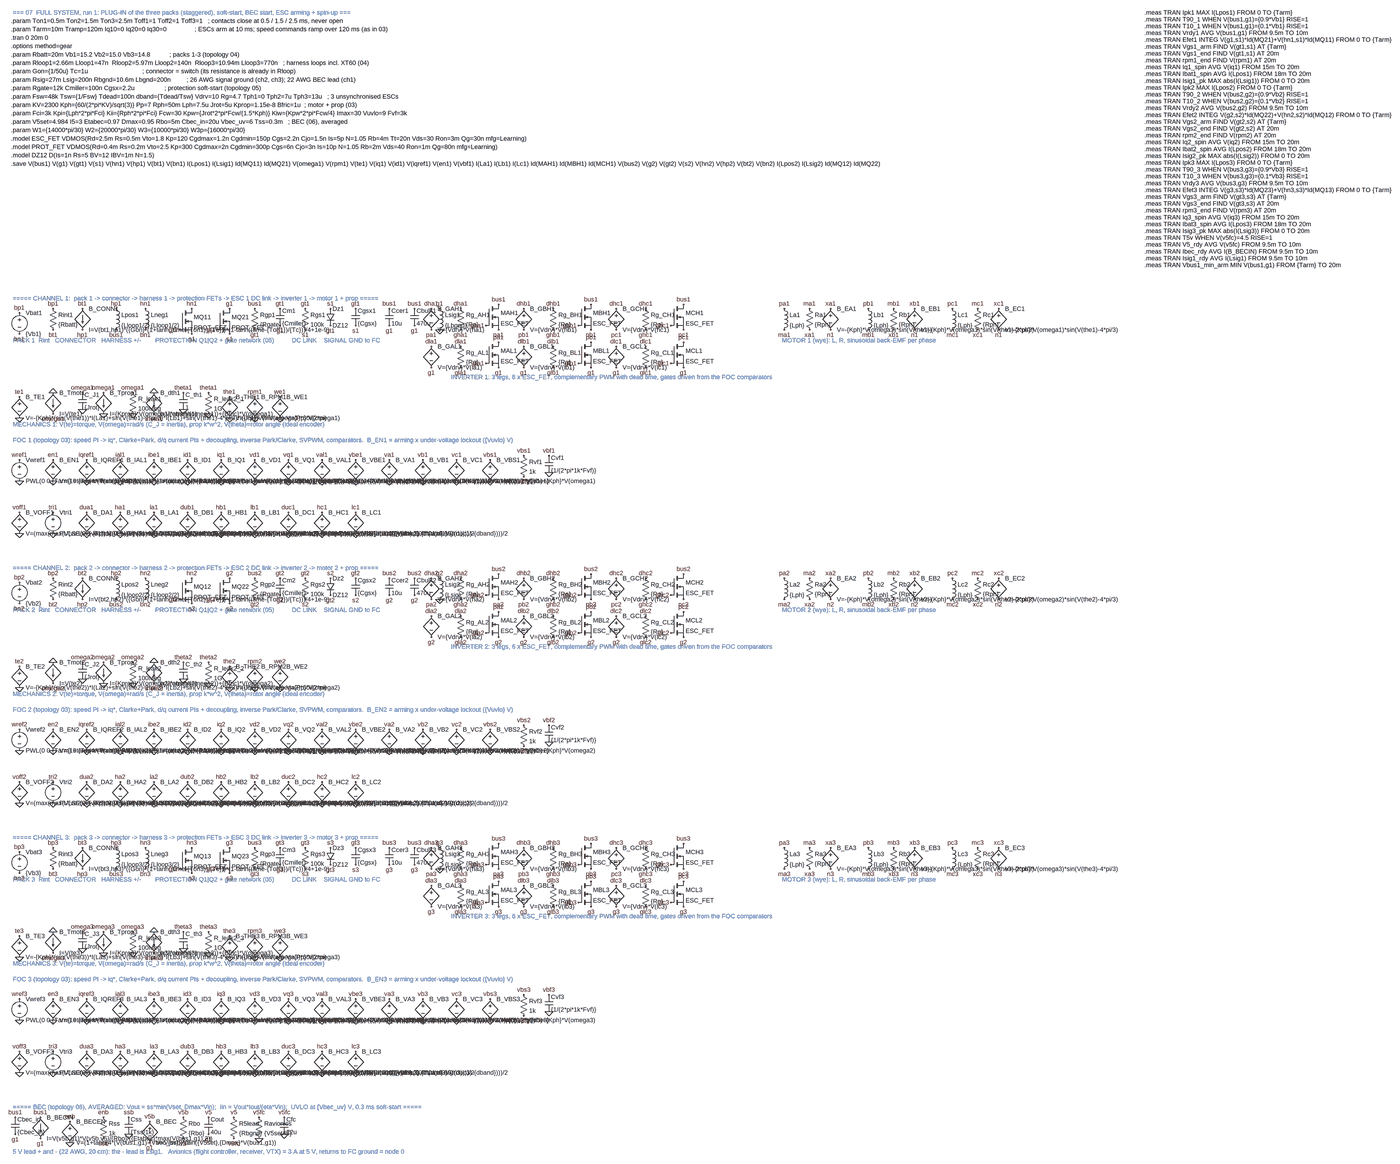
[diagram p0: schematic FullSystem_PlugIn.asc, whole sheet]
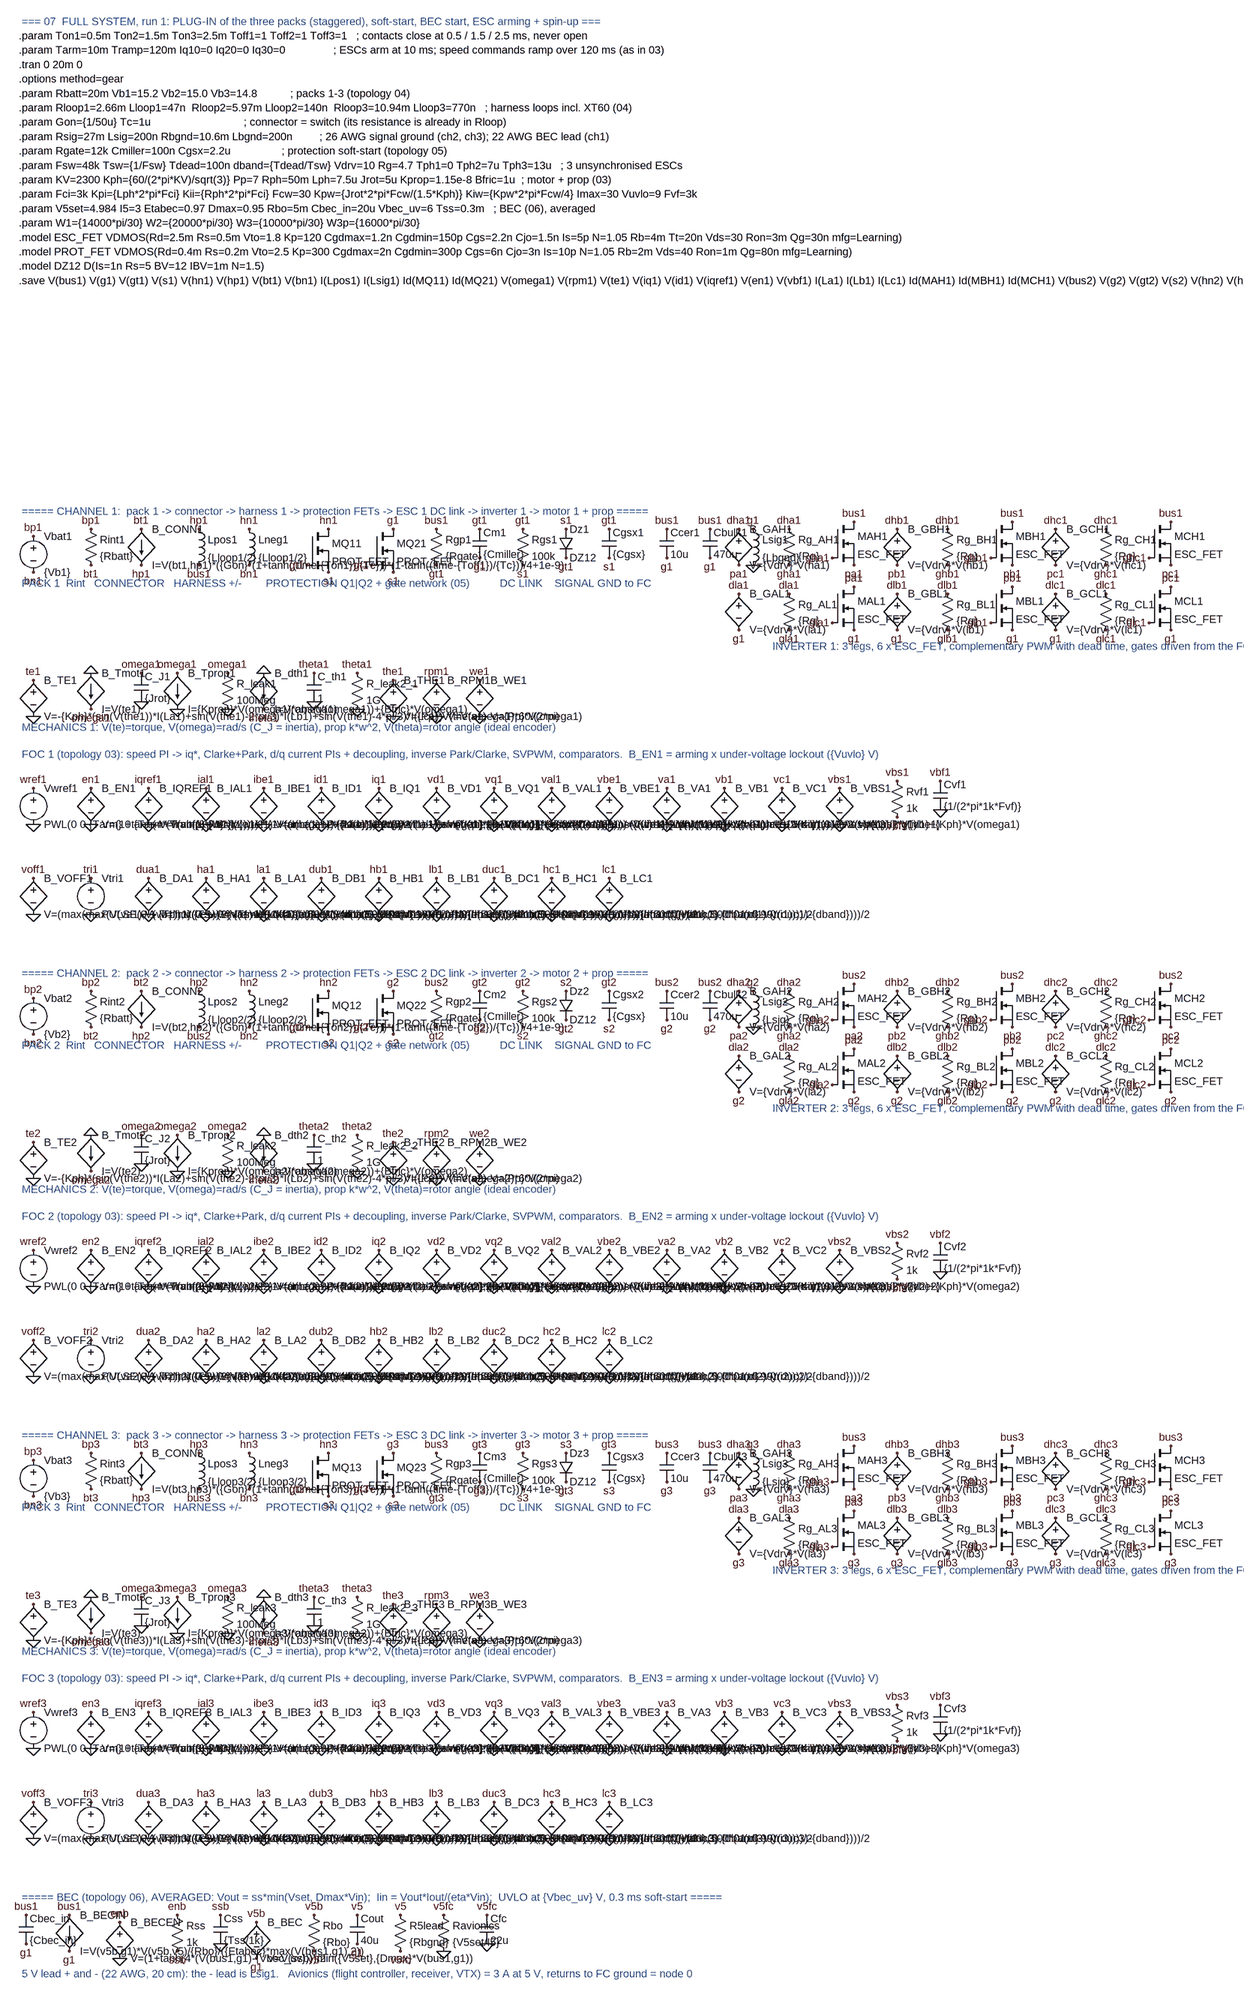
[diagram p1: schematic FullSystem_PlugIn.asc, part, row 1 of 1, column 1 of 2]
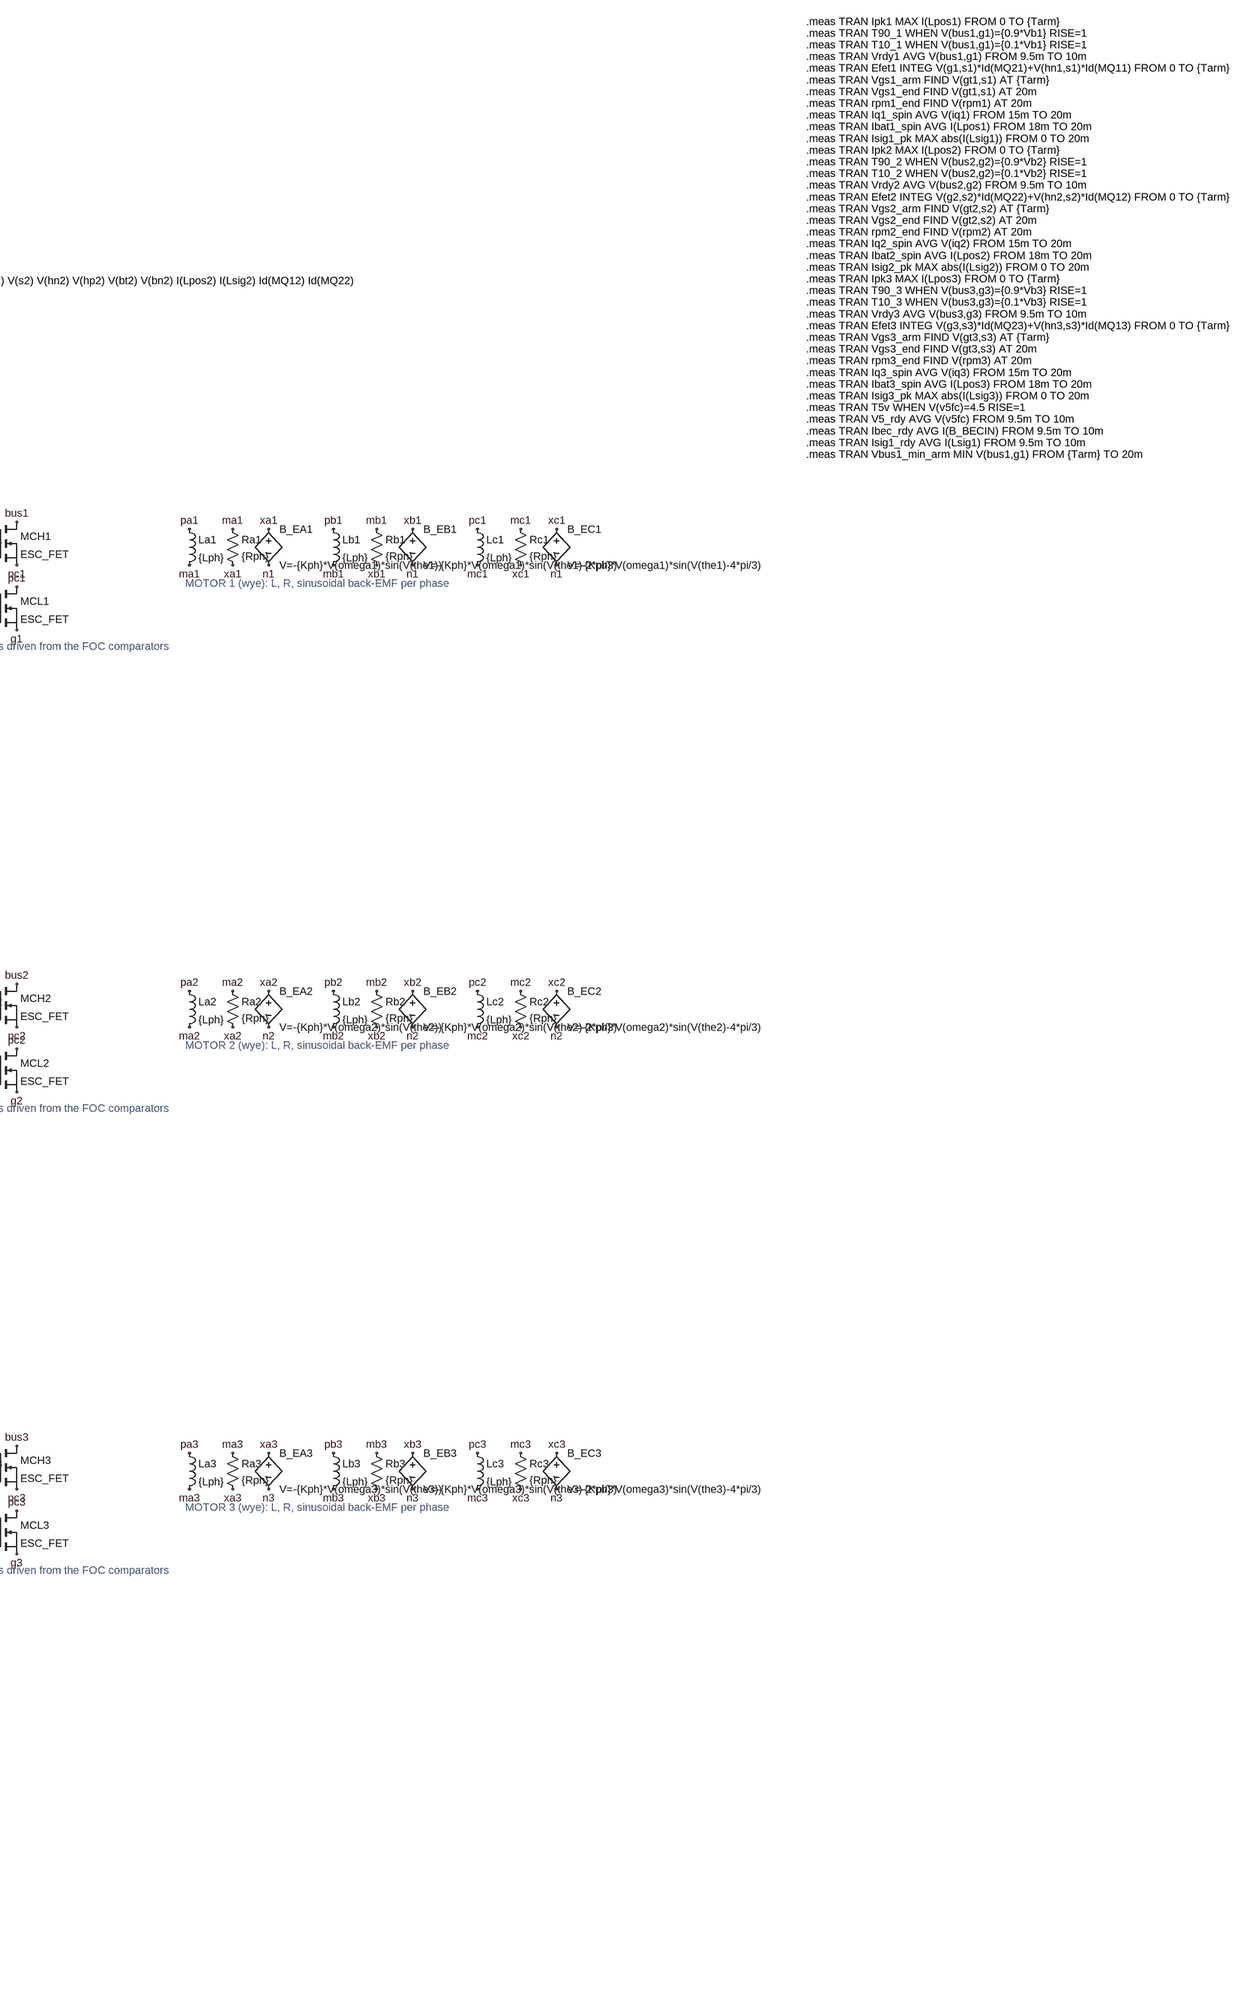
[diagram p2: schematic FullSystem_PlugIn.asc, part, row 1 of 1, column 2 of 2]
* FullSystem_PlugIn.asc
Vbat1 bp1 bn1 {Vb1}
Rint1 bp1 bt1 {Rbatt}
B_CONN1 bt1 hp1 I=V(bt1,hp1)*({Gon}*(1+tanh((time-{Ton1})/{Tc}))*(1-tanh((time-{Toff1})/{Tc}))/4+1e-9)
Lpos1 hp1 bus1 {Lloop1/2} Rser={Rloop1/2}
Lneg1 hn1 bn1 {Lloop1/2} Rser={Rloop1/2}
MQ11 hn1 gt1 s1 s1 PROT_FET
MQ21 g1 gt1 s1 s1 PROT_FET
Rgp1 bus1 gt1 {Rgate}
Cm1 gt1 g1 {Cmiller}
Rgs1 gt1 s1 100k
Dz1 s1 gt1 DZ12
Cgsx1 gt1 s1 {Cgsx}
Ccer1 bus1 g1 10u Rser=2m
Cbulk1 bus1 g1 470u Rser=30m Lser=10n
Lsig1 g1 0 {Lbgnd} Rser={Rbgnd}
MAH1 bus1 gha1 pa1 pa1 ESC_FET
MAL1 pa1 gla1 g1 g1 ESC_FET
Rg_AH1 dha1 gha1 {Rg}
Rg_AL1 dla1 gla1 {Rg}
B_GAH1 dha1 pa1 V={Vdrv}*V(ha1)
B_GAL1 dla1 g1 V={Vdrv}*V(la1)
MBH1 bus1 ghb1 pb1 pb1 ESC_FET
MBL1 pb1 glb1 g1 g1 ESC_FET
Rg_BH1 dhb1 ghb1 {Rg}
Rg_BL1 dlb1 glb1 {Rg}
B_GBH1 dhb1 pb1 V={Vdrv}*V(hb1)
B_GBL1 dlb1 g1 V={Vdrv}*V(lb1)
MCH1 bus1 ghc1 pc1 pc1 ESC_FET
MCL1 pc1 glc1 g1 g1 ESC_FET
Rg_CH1 dhc1 ghc1 {Rg}
Rg_CL1 dlc1 glc1 {Rg}
B_GCH1 dhc1 pc1 V={Vdrv}*V(hc1)
B_GCL1 dlc1 g1 V={Vdrv}*V(lc1)
La1 pa1 ma1 {Lph}
Ra1 ma1 xa1 {Rph}
B_EA1 xa1 n1 V=-{Kph}*V(omega1)*sin(V(the1))
Lb1 pb1 mb1 {Lph}
Rb1 mb1 xb1 {Rph}
B_EB1 xb1 n1 V=-{Kph}*V(omega1)*sin(V(the1)-2*pi/3)
Lc1 pc1 mc1 {Lph}
Rc1 mc1 xc1 {Rph}
B_EC1 xc1 n1 V=-{Kph}*V(omega1)*sin(V(the1)-4*pi/3)
B_TE1 te1 0 V=-{Kph}*(sin(V(the1))*I(La1)+sin(V(the1)-2*pi/3)*I(Lb1)+sin(V(the1)-4*pi/3)*I(Lc1))
B_Tmot1 0 omega1 I=V(te1)
C_J1 omega1 0 {Jrot}
B_Tprop1 omega1 0 I={Kprop}*V(omega1)*abs(V(omega1))+{Bfric}*V(omega1)
R_leak1 omega1 0 100Meg
B_dth1 0 theta1 I=V(omega1)
C_th1 theta1 0 1
R_leak2_1 theta1 0 1G
B_THE1 the1 0 V={Pp}*V(theta1)
B_RPM1 rpm1 0 V=V(omega1)*60/(2*pi)
B_WE1 we1 0 V={Pp}*V(omega1)
Vwref1 wref1 0 PWL(0 0 {Tarm} 0 {Tarm+Tramp} {W1})
B_EN1 en1 0 V=(1+tanh(4*(V(vbf1)-{Vuvlo})))/2*(1+tanh((time-{Tarm})/20u))/2
B_IQREF1 iqref1 0 V=limit({Kpw}*(V(wref1)-V(omega1))+{Kiw}*idt(V(wref1)-V(omega1),{Iq10/Kiw}),-{Imax},{Imax})
B_IAL1 ial1 0 V=I(La1)
B_IBE1 ibe1 0 V=(I(La1)+2*I(Lb1))/sqrt(3)
B_ID1 id1 0 V=V(ial1)*cos(V(the1))+V(ibe1)*sin(V(the1))
B_IQ1 iq1 0 V=-V(ial1)*sin(V(the1))+V(ibe1)*cos(V(the1))
B_VD1 vd1 0 V={Kpi}*(0-V(id1))+{Kii}*idt(0-V(id1)) - V(we1)*{Lph}*V(iq1)
B_VQ1 vq1 0 V={Kpi}*(V(iqref1)-V(iq1))+{Kii}*idt(V(iqref1)-V(iq1),{Rph*Iq10/Kii}) + V(we1)*{Lph}*V(id1)+{Kph}*V(omega1)
B_VAL1 val1 0 V=V(vd1)*cos(V(the1))-V(vq1)*sin(V(the1))
B_VBE1 vbe1 0 V=V(vd1)*sin(V(the1))+V(vq1)*cos(V(the1))
B_VA1 va1 0 V=V(val1)
B_VB1 vb1 0 V=-V(val1)/2+sqrt(3)/2*V(vbe1)
B_VC1 vc1 0 V=-V(val1)/2-sqrt(3)/2*V(vbe1)
B_VOFF1 voff1 0 V=(max(max(V(va1),V(vb1)),V(vc1))+min(min(V(va1),V(vb1)),V(vc1)))/2
Vtri1 tri1 0 PULSE(0 1 {Tph1} {Tsw/2} {Tsw/2} 0 {Tsw})
B_DA1 dua1 0 V=limit(0.5+(V(va1)-V(voff1))/max(V(vbf1),3), 0.01, 0.99)
B_HA1 ha1 0 V=V(en1)*(1+tanh(500*(V(dua1)-{dband}-V(tri1))))/2
B_LA1 la1 0 V=V(en1)*(1+tanh(500*(V(tri1)-V(dua1)-{dband})))/2
B_DB1 dub1 0 V=limit(0.5+(V(vb1)-V(voff1))/max(V(vbf1),3), 0.01, 0.99)
B_HB1 hb1 0 V=V(en1)*(1+tanh(500*(V(dub1)-{dband}-V(tri1))))/2
B_LB1 lb1 0 V=V(en1)*(1+tanh(500*(V(tri1)-V(dub1)-{dband})))/2
B_DC1 duc1 0 V=limit(0.5+(V(vc1)-V(voff1))/max(V(vbf1),3), 0.01, 0.99)
B_HC1 hc1 0 V=V(en1)*(1+tanh(500*(V(duc1)-{dband}-V(tri1))))/2
B_LC1 lc1 0 V=V(en1)*(1+tanh(500*(V(tri1)-V(duc1)-{dband})))/2
B_VBS1 vbs1 0 V=V(bus1,g1)
Rvf1 vbs1 vbf1 1k
Cvf1 vbf1 0 {1/(2*pi*1k*Fvf)}
Vbat2 bp2 bn2 {Vb2}
Rint2 bp2 bt2 {Rbatt}
B_CONN2 bt2 hp2 I=V(bt2,hp2)*({Gon}*(1+tanh((time-{Ton2})/{Tc}))*(1-tanh((time-{Toff2})/{Tc}))/4+1e-9)
Lpos2 hp2 bus2 {Lloop2/2} Rser={Rloop2/2}
Lneg2 hn2 bn2 {Lloop2/2} Rser={Rloop2/2}
MQ12 hn2 gt2 s2 s2 PROT_FET
MQ22 g2 gt2 s2 s2 PROT_FET
Rgp2 bus2 gt2 {Rgate}
Cm2 gt2 g2 {Cmiller}
Rgs2 gt2 s2 100k
Dz2 s2 gt2 DZ12
Cgsx2 gt2 s2 {Cgsx}
Ccer2 bus2 g2 10u Rser=2m
Cbulk2 bus2 g2 470u Rser=30m Lser=10n
Lsig2 g2 0 {Lsig} Rser={Rsig}
MAH2 bus2 gha2 pa2 pa2 ESC_FET
MAL2 pa2 gla2 g2 g2 ESC_FET
Rg_AH2 dha2 gha2 {Rg}
Rg_AL2 dla2 gla2 {Rg}
B_GAH2 dha2 pa2 V={Vdrv}*V(ha2)
B_GAL2 dla2 g2 V={Vdrv}*V(la2)
MBH2 bus2 ghb2 pb2 pb2 ESC_FET
MBL2 pb2 glb2 g2 g2 ESC_FET
Rg_BH2 dhb2 ghb2 {Rg}
Rg_BL2 dlb2 glb2 {Rg}
B_GBH2 dhb2 pb2 V={Vdrv}*V(hb2)
B_GBL2 dlb2 g2 V={Vdrv}*V(lb2)
MCH2 bus2 ghc2 pc2 pc2 ESC_FET
MCL2 pc2 glc2 g2 g2 ESC_FET
Rg_CH2 dhc2 ghc2 {Rg}
Rg_CL2 dlc2 glc2 {Rg}
B_GCH2 dhc2 pc2 V={Vdrv}*V(hc2)
B_GCL2 dlc2 g2 V={Vdrv}*V(lc2)
La2 pa2 ma2 {Lph}
Ra2 ma2 xa2 {Rph}
B_EA2 xa2 n2 V=-{Kph}*V(omega2)*sin(V(the2))
Lb2 pb2 mb2 {Lph}
Rb2 mb2 xb2 {Rph}
B_EB2 xb2 n2 V=-{Kph}*V(omega2)*sin(V(the2)-2*pi/3)
Lc2 pc2 mc2 {Lph}
Rc2 mc2 xc2 {Rph}
B_EC2 xc2 n2 V=-{Kph}*V(omega2)*sin(V(the2)-4*pi/3)
B_TE2 te2 0 V=-{Kph}*(sin(V(the2))*I(La2)+sin(V(the2)-2*pi/3)*I(Lb2)+sin(V(the2)-4*pi/3)*I(Lc2))
B_Tmot2 0 omega2 I=V(te2)
C_J2 omega2 0 {Jrot}
B_Tprop2 omega2 0 I={Kprop}*V(omega2)*abs(V(omega2))+{Bfric}*V(omega2)
R_leak2 omega2 0 100Meg
B_dth2 0 theta2 I=V(omega2)
C_th2 theta2 0 1
R_leak2_2 theta2 0 1G
B_THE2 the2 0 V={Pp}*V(theta2)
B_RPM2 rpm2 0 V=V(omega2)*60/(2*pi)
B_WE2 we2 0 V={Pp}*V(omega2)
Vwref2 wref2 0 PWL(0 0 {Tarm} 0 {Tarm+Tramp} {W2})
B_EN2 en2 0 V=(1+tanh(4*(V(vbf2)-{Vuvlo})))/2*(1+tanh((time-{Tarm})/20u))/2
B_IQREF2 iqref2 0 V=limit({Kpw}*(V(wref2)-V(omega2))+{Kiw}*idt(V(wref2)-V(omega2),{Iq20/Kiw}),-{Imax},{Imax})
B_IAL2 ial2 0 V=I(La2)
B_IBE2 ibe2 0 V=(I(La2)+2*I(Lb2))/sqrt(3)
B_ID2 id2 0 V=V(ial2)*cos(V(the2))+V(ibe2)*sin(V(the2))
B_IQ2 iq2 0 V=-V(ial2)*sin(V(the2))+V(ibe2)*cos(V(the2))
B_VD2 vd2 0 V={Kpi}*(0-V(id2))+{Kii}*idt(0-V(id2)) - V(we2)*{Lph}*V(iq2)
B_VQ2 vq2 0 V={Kpi}*(V(iqref2)-V(iq2))+{Kii}*idt(V(iqref2)-V(iq2),{Rph*Iq20/Kii}) + V(we2)*{Lph}*V(id2)+{Kph}*V(omega2)
B_VAL2 val2 0 V=V(vd2)*cos(V(the2))-V(vq2)*sin(V(the2))
B_VBE2 vbe2 0 V=V(vd2)*sin(V(the2))+V(vq2)*cos(V(the2))
B_VA2 va2 0 V=V(val2)
B_VB2 vb2 0 V=-V(val2)/2+sqrt(3)/2*V(vbe2)
B_VC2 vc2 0 V=-V(val2)/2-sqrt(3)/2*V(vbe2)
B_VOFF2 voff2 0 V=(max(max(V(va2),V(vb2)),V(vc2))+min(min(V(va2),V(vb2)),V(vc2)))/2
Vtri2 tri2 0 PULSE(0 1 {Tph2} {Tsw/2} {Tsw/2} 0 {Tsw})
B_DA2 dua2 0 V=limit(0.5+(V(va2)-V(voff2))/max(V(vbf2),3), 0.01, 0.99)
B_HA2 ha2 0 V=V(en2)*(1+tanh(500*(V(dua2)-{dband}-V(tri2))))/2
B_LA2 la2 0 V=V(en2)*(1+tanh(500*(V(tri2)-V(dua2)-{dband})))/2
B_DB2 dub2 0 V=limit(0.5+(V(vb2)-V(voff2))/max(V(vbf2),3), 0.01, 0.99)
B_HB2 hb2 0 V=V(en2)*(1+tanh(500*(V(dub2)-{dband}-V(tri2))))/2
B_LB2 lb2 0 V=V(en2)*(1+tanh(500*(V(tri2)-V(dub2)-{dband})))/2
B_DC2 duc2 0 V=limit(0.5+(V(vc2)-V(voff2))/max(V(vbf2),3), 0.01, 0.99)
B_HC2 hc2 0 V=V(en2)*(1+tanh(500*(V(duc2)-{dband}-V(tri2))))/2
B_LC2 lc2 0 V=V(en2)*(1+tanh(500*(V(tri2)-V(duc2)-{dband})))/2
B_VBS2 vbs2 0 V=V(bus2,g2)
Rvf2 vbs2 vbf2 1k
Cvf2 vbf2 0 {1/(2*pi*1k*Fvf)}
Vbat3 bp3 bn3 {Vb3}
Rint3 bp3 bt3 {Rbatt}
B_CONN3 bt3 hp3 I=V(bt3,hp3)*({Gon}*(1+tanh((time-{Ton3})/{Tc}))*(1-tanh((time-{Toff3})/{Tc}))/4+1e-9)
Lpos3 hp3 bus3 {Lloop3/2} Rser={Rloop3/2}
Lneg3 hn3 bn3 {Lloop3/2} Rser={Rloop3/2}
MQ13 hn3 gt3 s3 s3 PROT_FET
MQ23 g3 gt3 s3 s3 PROT_FET
Rgp3 bus3 gt3 {Rgate}
Cm3 gt3 g3 {Cmiller}
Rgs3 gt3 s3 100k
Dz3 s3 gt3 DZ12
Cgsx3 gt3 s3 {Cgsx}
Ccer3 bus3 g3 10u Rser=2m
Cbulk3 bus3 g3 470u Rser=30m Lser=10n
Lsig3 g3 0 {Lsig} Rser={Rsig}
MAH3 bus3 gha3 pa3 pa3 ESC_FET
MAL3 pa3 gla3 g3 g3 ESC_FET
Rg_AH3 dha3 gha3 {Rg}
Rg_AL3 dla3 gla3 {Rg}
B_GAH3 dha3 pa3 V={Vdrv}*V(ha3)
B_GAL3 dla3 g3 V={Vdrv}*V(la3)
MBH3 bus3 ghb3 pb3 pb3 ESC_FET
MBL3 pb3 glb3 g3 g3 ESC_FET
Rg_BH3 dhb3 ghb3 {Rg}
Rg_BL3 dlb3 glb3 {Rg}
B_GBH3 dhb3 pb3 V={Vdrv}*V(hb3)
B_GBL3 dlb3 g3 V={Vdrv}*V(lb3)
MCH3 bus3 ghc3 pc3 pc3 ESC_FET
MCL3 pc3 glc3 g3 g3 ESC_FET
Rg_CH3 dhc3 ghc3 {Rg}
Rg_CL3 dlc3 glc3 {Rg}
B_GCH3 dhc3 pc3 V={Vdrv}*V(hc3)
B_GCL3 dlc3 g3 V={Vdrv}*V(lc3)
La3 pa3 ma3 {Lph}
Ra3 ma3 xa3 {Rph}
B_EA3 xa3 n3 V=-{Kph}*V(omega3)*sin(V(the3))
Lb3 pb3 mb3 {Lph}
Rb3 mb3 xb3 {Rph}
B_EB3 xb3 n3 V=-{Kph}*V(omega3)*sin(V(the3)-2*pi/3)
Lc3 pc3 mc3 {Lph}
Rc3 mc3 xc3 {Rph}
B_EC3 xc3 n3 V=-{Kph}*V(omega3)*sin(V(the3)-4*pi/3)
B_TE3 te3 0 V=-{Kph}*(sin(V(the3))*I(La3)+sin(V(the3)-2*pi/3)*I(Lb3)+sin(V(the3)-4*pi/3)*I(Lc3))
B_Tmot3 0 omega3 I=V(te3)
C_J3 omega3 0 {Jrot}
B_Tprop3 omega3 0 I={Kprop}*V(omega3)*abs(V(omega3))+{Bfric}*V(omega3)
R_leak3 omega3 0 100Meg
B_dth3 0 theta3 I=V(omega3)
C_th3 theta3 0 1
R_leak2_3 theta3 0 1G
B_THE3 the3 0 V={Pp}*V(theta3)
B_RPM3 rpm3 0 V=V(omega3)*60/(2*pi)
B_WE3 we3 0 V={Pp}*V(omega3)
Vwref3 wref3 0 PWL(0 0 {Tarm} 0 {Tarm+Tramp} {W3})
B_EN3 en3 0 V=(1+tanh(4*(V(vbf3)-{Vuvlo})))/2*(1+tanh((time-{Tarm})/20u))/2
B_IQREF3 iqref3 0 V=limit({Kpw}*(V(wref3)-V(omega3))+{Kiw}*idt(V(wref3)-V(omega3),{Iq30/Kiw}),-{Imax},{Imax})
B_IAL3 ial3 0 V=I(La3)
B_IBE3 ibe3 0 V=(I(La3)+2*I(Lb3))/sqrt(3)
B_ID3 id3 0 V=V(ial3)*cos(V(the3))+V(ibe3)*sin(V(the3))
B_IQ3 iq3 0 V=-V(ial3)*sin(V(the3))+V(ibe3)*cos(V(the3))
B_VD3 vd3 0 V={Kpi}*(0-V(id3))+{Kii}*idt(0-V(id3)) - V(we3)*{Lph}*V(iq3)
B_VQ3 vq3 0 V={Kpi}*(V(iqref3)-V(iq3))+{Kii}*idt(V(iqref3)-V(iq3),{Rph*Iq30/Kii}) + V(we3)*{Lph}*V(id3)+{Kph}*V(omega3)
B_VAL3 val3 0 V=V(vd3)*cos(V(the3))-V(vq3)*sin(V(the3))
B_VBE3 vbe3 0 V=V(vd3)*sin(V(the3))+V(vq3)*cos(V(the3))
B_VA3 va3 0 V=V(val3)
B_VB3 vb3 0 V=-V(val3)/2+sqrt(3)/2*V(vbe3)
B_VC3 vc3 0 V=-V(val3)/2-sqrt(3)/2*V(vbe3)
B_VOFF3 voff3 0 V=(max(max(V(va3),V(vb3)),V(vc3))+min(min(V(va3),V(vb3)),V(vc3)))/2
Vtri3 tri3 0 PULSE(0 1 {Tph3} {Tsw/2} {Tsw/2} 0 {Tsw})
B_DA3 dua3 0 V=limit(0.5+(V(va3)-V(voff3))/max(V(vbf3),3), 0.01, 0.99)
B_HA3 ha3 0 V=V(en3)*(1+tanh(500*(V(dua3)-{dband}-V(tri3))))/2
B_LA3 la3 0 V=V(en3)*(1+tanh(500*(V(tri3)-V(dua3)-{dband})))/2
B_DB3 dub3 0 V=limit(0.5+(V(vb3)-V(voff3))/max(V(vbf3),3), 0.01, 0.99)
B_HB3 hb3 0 V=V(en3)*(1+tanh(500*(V(dub3)-{dband}-V(tri3))))/2
B_LB3 lb3 0 V=V(en3)*(1+tanh(500*(V(tri3)-V(dub3)-{dband})))/2
B_DC3 duc3 0 V=limit(0.5+(V(vc3)-V(voff3))/max(V(vbf3),3), 0.01, 0.99)
B_HC3 hc3 0 V=V(en3)*(1+tanh(500*(V(duc3)-{dband}-V(tri3))))/2
B_LC3 lc3 0 V=V(en3)*(1+tanh(500*(V(tri3)-V(duc3)-{dband})))/2
B_VBS3 vbs3 0 V=V(bus3,g3)
Rvf3 vbs3 vbf3 1k
Cvf3 vbf3 0 {1/(2*pi*1k*Fvf)}
Cbec_in bus1 g1 {Cbec_in} Rser=3m Lser=0.5n
B_BECIN bus1 g1 I=V(v5b,g1)*V(v5b,v5)/{Rbo}/({Etabec}*max(V(bus1,g1),2))
B_BECEN enb 0 V=(1+tanh(4*(V(bus1,g1)-{Vbec_uv})))/2
Rss enb ssb 1k
Css ssb 0 {Tss/1k}
B_BEC v5b g1 V=V(ssb)*min({V5set},{Dmax}*V(bus1,g1))
Rbo v5b v5 {Rbo}
Cout v5 g1 40u Rser=3m
R5lead v5 v5fc {Rbgnd}
Ravionics v5fc 0 {V5set/I5}
Cfc v5fc 0 22u Rser=5m
.model D D
.lib standard.dio
.model NMOS NMOS
.model PMOS PMOS
.lib standard.mos
*  ===== CHANNEL 1:  pack 1 -> connector -> harness 1 -> protection FETs -> ESC 1 DC link -> inverter 1 -> motor 1 + prop =====
*  PACK 1  Rint   CONNECTOR   HARNESS +/-        PROTECTION Q1|Q2 + gate network (05)          DC LINK    SIGNAL GND to FC
*  INVERTER 1: 3 legs, 6 x ESC_FET, complementary PWM with dead time, gates driven from the FOC comparators
*  MOTOR 1 (wye): L, R, sinusoidal back-EMF per phase
*  MECHANICS 1: V(te)=torque, V(omega)=rad/s (C_J = inertia), prop k*w^2, V(theta)=rotor angle (ideal encoder)
*  FOC 1 (topology 03): speed PI -> iq*, Clarke+Park, d/q current PIs + decoupling, inverse Park/Clarke, SVPWM, comparators.  B_EN1 = arming x under-voltage lockout ({Vuvlo} V)
*  ===== CHANNEL 2:  pack 2 -> connector -> harness 2 -> protection FETs -> ESC 2 DC link -> inverter 2 -> motor 2 + prop =====
*  PACK 2  Rint   CONNECTOR   HARNESS +/-        PROTECTION Q1|Q2 + gate network (05)          DC LINK    SIGNAL GND to FC
*  INVERTER 2: 3 legs, 6 x ESC_FET, complementary PWM with dead time, gates driven from the FOC comparators
*  MOTOR 2 (wye): L, R, sinusoidal back-EMF per phase
*  MECHANICS 2: V(te)=torque, V(omega)=rad/s (C_J = inertia), prop k*w^2, V(theta)=rotor angle (ideal encoder)
*  FOC 2 (topology 03): speed PI -> iq*, Clarke+Park, d/q current PIs + decoupling, inverse Park/Clarke, SVPWM, comparators.  B_EN2 = arming x under-voltage lockout ({Vuvlo} V)
*  ===== CHANNEL 3:  pack 3 -> connector -> harness 3 -> protection FETs -> ESC 3 DC link -> inverter 3 -> motor 3 + prop =====
*  PACK 3  Rint   CONNECTOR   HARNESS +/-        PROTECTION Q1|Q2 + gate network (05)          DC LINK    SIGNAL GND to FC
*  INVERTER 3: 3 legs, 6 x ESC_FET, complementary PWM with dead time, gates driven from the FOC comparators
*  MOTOR 3 (wye): L, R, sinusoidal back-EMF per phase
*  MECHANICS 3: V(te)=torque, V(omega)=rad/s (C_J = inertia), prop k*w^2, V(theta)=rotor angle (ideal encoder)
*  FOC 3 (topology 03): speed PI -> iq*, Clarke+Park, d/q current PIs + decoupling, inverse Park/Clarke, SVPWM, comparators.  B_EN3 = arming x under-voltage lockout ({Vuvlo} V)
*  ===== BEC (topology 06), AVERAGED: Vout = ss*min(Vset, Dmax*Vin);  Iin = Vout*Iout/(eta*Vin);  UVLO at {Vbec_uv} V, 0.3 ms soft-start =====
*  5 V lead + and - (22 AWG, 20 cm): the - lead is Lsig1.   Avionics (flight controller, receiver, VTX) = 3 A at 5 V, returns to FC ground = node 0
*  === 07  FULL SYSTEM, run 1: PLUG-IN of the three packs (staggered), soft-start, BEC start, ESC arming + spin-up ===
.param Ton1=0.5m Ton2=1.5m Ton3=2.5m Toff1=1 Toff2=1 Toff3=1   ; contacts close at 0.5 / 1.5 / 2.5 ms, never open
.param Tarm=10m Tramp=120m Iq10=0 Iq20=0 Iq30=0                ; ESCs arm at 10 ms; speed commands ramp over 120 ms (as in 03)
.tran 0 20m 0
.options method=gear
.param Rbatt=20m Vb1=15.2 Vb2=15.0 Vb3=14.8           ; packs 1-3 (topology 04)
.param Rloop1=2.66m Lloop1=47n  Rloop2=5.97m Lloop2=140n  Rloop3=10.94m Lloop3=770n   ; harness loops incl. XT60 (04)
.param Gon={1/50u} Tc=1u                               ; connector = switch (its resistance is already in Rloop)
.param Rsig=27m Lsig=200n Rbgnd=10.6m Lbgnd=200n         ; 26 AWG signal ground (ch2, ch3); 22 AWG BEC lead (ch1)
.param Rgate=12k Cmiller=100n Cgsx=2.2u                 ; protection soft-start (topology 05)
.param Fsw=48k Tsw={1/Fsw} Tdead=100n dband={Tdead/Tsw} Vdrv=10 Rg=4.7 Tph1=0 Tph2=7u Tph3=13u   ; 3 unsynchronised ESCs
.param KV=2300 Kph={60/(2*pi*KV)/sqrt(3)} Pp=7 Rph=50m Lph=7.5u Jrot=5u Kprop=1.15e-8 Bfric=1u  ; motor + prop (03)
.param Fci=3k Kpi={Lph*2*pi*Fci} Kii={Rph*2*pi*Fci} Fcw=30 Kpw={Jrot*2*pi*Fcw/(1.5*Kph)} Kiw={Kpw*2*pi*Fcw/4} Imax=30 Vuvlo=9 Fvf=3k
.param V5set=4.984 I5=3 Etabec=0.97 Dmax=0.95 Rbo=5m Cbec_in=20u Vbec_uv=6 Tss=0.3m   ; BEC (06), averaged
.param W1={14000*pi/30} W2={20000*pi/30} W3={10000*pi/30} W3p={16000*pi/30}
.model ESC_FET VDMOS(Rd=2.5m Rs=0.5m Vto=1.8 Kp=120 Cgdmax=1.2n Cgdmin=150p Cgs=2.2n Cjo=1.5n Is=5p N=1.05 Rb=4m Tt=20n Vds=30 Ron=3m Qg=30n mfg=Learning)
.model PROT_FET VDMOS(Rd=0.4m Rs=0.2m Vto=2.5 Kp=300 Cgdmax=2n Cgdmin=300p Cgs=6n Cjo=3n Is=10p N=1.05 Rb=2m Vds=40 Ron=1m Qg=80n mfg=Learning)
.model DZ12 D(Is=1n Rs=5 BV=12 IBV=1m N=1.5)
.save V(bus1) V(g1) V(gt1) V(s1) V(hn1) V(hp1) V(bt1) V(bn1) I(Lpos1) I(Lsig1) Id(MQ11) Id(MQ21) V(omega1) V(rpm1) V(te1) V(iq1) V(id1) V(iqref1) V(en1) V(vbf1) I(La1) I(Lb1) I(Lc1) Id(MAH1) Id(MBH1) Id(MCH1) V(bus2) V(g2) V(gt2) V(s2) V(hn2) V(hp2) V(bt2) V(bn2) I(Lpos2) I(Lsig2) Id(MQ12) Id(MQ22) V(omega2) V(rpm2) V(te2) V(iq2) V(id2) V(iqref2) V(en2) V(vbf2) I(La2) I(Lb2) I(Lc2) Id(MAH2) Id(MBH2) Id(MCH2) V(bus3) V(g3) V(gt3) V(s3) V(hn3) V(hp3) V(bt3) V(bn3) I(Lpos3) I(Lsig3) Id(MQ13) Id(MQ23) V(omega3) V(rpm3) V(te3) V(iq3) V(id3) V(iqref3) V(en3) V(vbf3) I(La3) I(Lb3) I(Lc3) Id(MAH3) Id(MBH3) Id(MCH3) V(v5) V(v5fc) V(v5b) I(B_BECIN) V(ssb)
.meas TRAN Ipk1 MAX I(Lpos1) FROM 0 TO {Tarm}
.meas TRAN T90_1 WHEN V(bus1,g1)={0.9*Vb1} RISE=1
.meas TRAN T10_1 WHEN V(bus1,g1)={0.1*Vb1} RISE=1
.meas TRAN Vrdy1 AVG V(bus1,g1) FROM 9.5m TO 10m
.meas TRAN Efet1 INTEG V(g1,s1)*Id(MQ21)+V(hn1,s1)*Id(MQ11) FROM 0 TO {Tarm}
.meas TRAN Vgs1_arm FIND V(gt1,s1) AT {Tarm}
.meas TRAN Vgs1_end FIND V(gt1,s1) AT 20m
.meas TRAN rpm1_end FIND V(rpm1) AT 20m
.meas TRAN Iq1_spin AVG V(iq1) FROM 15m TO 20m
.meas TRAN Ibat1_spin AVG I(Lpos1) FROM 18m TO 20m
.meas TRAN Isig1_pk MAX abs(I(Lsig1)) FROM 0 TO 20m
.meas TRAN Ipk2 MAX I(Lpos2) FROM 0 TO {Tarm}
.meas TRAN T90_2 WHEN V(bus2,g2)={0.9*Vb2} RISE=1
.meas TRAN T10_2 WHEN V(bus2,g2)={0.1*Vb2} RISE=1
.meas TRAN Vrdy2 AVG V(bus2,g2) FROM 9.5m TO 10m
.meas TRAN Efet2 INTEG V(g2,s2)*Id(MQ22)+V(hn2,s2)*Id(MQ12) FROM 0 TO {Tarm}
.meas TRAN Vgs2_arm FIND V(gt2,s2) AT {Tarm}
.meas TRAN Vgs2_end FIND V(gt2,s2) AT 20m
.meas TRAN rpm2_end FIND V(rpm2) AT 20m
.meas TRAN Iq2_spin AVG V(iq2) FROM 15m TO 20m
.meas TRAN Ibat2_spin AVG I(Lpos2) FROM 18m TO 20m
.meas TRAN Isig2_pk MAX abs(I(Lsig2)) FROM 0 TO 20m
.meas TRAN Ipk3 MAX I(Lpos3) FROM 0 TO {Tarm}
.meas TRAN T90_3 WHEN V(bus3,g3)={0.9*Vb3} RISE=1
.meas TRAN T10_3 WHEN V(bus3,g3)={0.1*Vb3} RISE=1
.meas TRAN Vrdy3 AVG V(bus3,g3) FROM 9.5m TO 10m
.meas TRAN Efet3 INTEG V(g3,s3)*Id(MQ23)+V(hn3,s3)*Id(MQ13) FROM 0 TO {Tarm}
.meas TRAN Vgs3_arm FIND V(gt3,s3) AT {Tarm}
.meas TRAN Vgs3_end FIND V(gt3,s3) AT 20m
.meas TRAN rpm3_end FIND V(rpm3) AT 20m
.meas TRAN Iq3_spin AVG V(iq3) FROM 15m TO 20m
.meas TRAN Ibat3_spin AVG I(Lpos3) FROM 18m TO 20m
.meas TRAN Isig3_pk MAX abs(I(Lsig3)) FROM 0 TO 20m
.meas TRAN T5v WHEN V(v5fc)=4.5 RISE=1
.meas TRAN V5_rdy AVG V(v5fc) FROM 9.5m TO 10m
.meas TRAN Ibec_rdy AVG I(B_BECIN) FROM 9.5m TO 10m
.meas TRAN Isig1_rdy AVG I(Lsig1) FROM 9.5m TO 10m
.meas TRAN Vbus1_min_arm MIN V(bus1,g1) FROM {Tarm} TO 20m
.backanno
.end